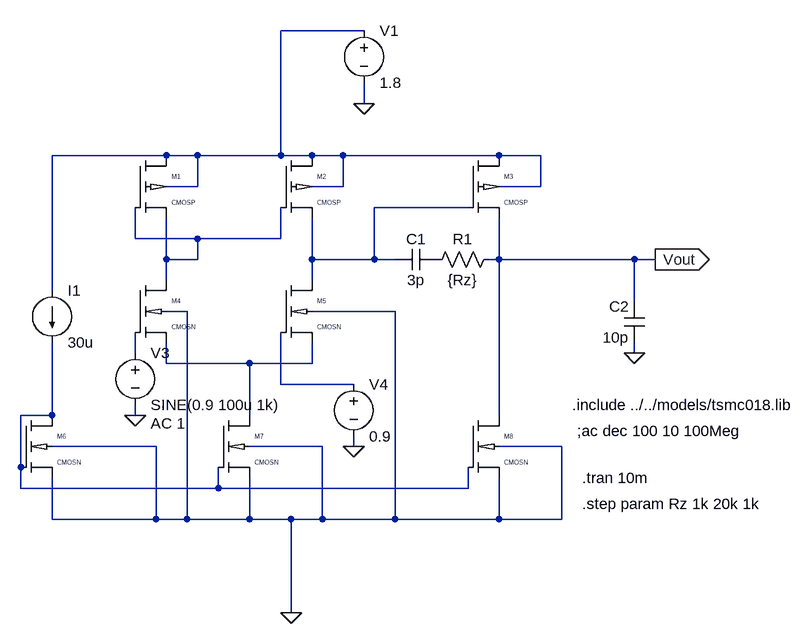
[diagram p0: schematic 2-Stage op-Amp.asc]
2-Stage op-Amp.asc, the LTspice schematic file:
Version 4.1
SHEET 1 1564 852
WIRE 432 -144 304 -144
WIRE 432 -32 432 -64
WIRE 128 48 -48 48
WIRE 176 48 128 48
WIRE 304 48 304 -144
WIRE 304 48 176 48
WIRE 352 48 304 48
WIRE 400 48 352 48
WIRE 640 48 400 48
WIRE 704 48 640 48
WIRE 176 96 176 48
WIRE 176 96 128 96
WIRE 400 96 400 48
WIRE 400 96 352 96
WIRE 704 96 704 48
WIRE 704 96 640 96
WIRE 592 128 448 128
WIRE 80 176 80 128
WIRE 176 176 80 176
WIRE 304 176 304 128
WIRE 304 176 176 176
WIRE 128 208 128 144
WIRE 176 208 176 176
WIRE 176 208 128 208
WIRE 352 208 352 144
WIRE 448 208 448 128
WIRE 448 208 352 208
WIRE 480 208 448 208
WIRE 640 208 640 144
WIRE 640 208 624 208
WIRE 848 208 640 208
WIRE 880 208 848 208
WIRE 128 240 128 208
WIRE 352 240 352 208
WIRE -48 256 -48 48
WIRE 848 272 848 208
WIRE 160 288 128 288
WIRE 480 288 352 288
WIRE 80 352 80 320
WIRE 848 352 848 336
WIRE 128 368 128 336
WIRE 256 368 128 368
WIRE 352 368 352 336
WIRE 352 368 256 368
WIRE 304 400 304 320
WIRE 416 400 304 400
WIRE -48 448 -48 336
WIRE -48 448 -96 448
WIRE 80 448 80 432
WIRE 256 448 256 368
WIRE 640 448 640 208
WIRE 112 496 -48 496
WIRE 368 496 256 496
WIRE 416 496 416 480
WIRE 736 496 640 496
WIRE -96 528 -96 448
WIRE -96 560 -96 528
WIRE 208 560 208 528
WIRE 208 560 -96 560
WIRE 592 560 592 528
WIRE 592 560 208 560
WIRE -48 608 -48 544
WIRE 112 608 112 496
WIRE 112 608 -48 608
WIRE 160 608 160 288
WIRE 160 608 112 608
WIRE 256 608 256 544
WIRE 256 608 160 608
WIRE 320 608 256 608
WIRE 368 608 368 496
WIRE 368 608 320 608
WIRE 480 608 480 288
WIRE 480 608 368 608
WIRE 640 608 640 544
WIRE 640 608 480 608
WIRE 736 608 736 496
WIRE 736 608 640 608
WIRE 320 752 320 608
FLAG 848 352 0
FLAG 880 208 Vout
IOPIN 880 208 Out
FLAG 432 -32 0
FLAG 80 448 0
FLAG 416 496 0
FLAG 320 752 0
SYMBOL sym\\cmosp 80 48 R0
SYMATTR InstName M1
SYMATTR Value2 l=0.5u w=20u
SYMBOL sym\\cmosp 304 48 R0
SYMATTR InstName M2
SYMATTR Value2 l=0.5u w=20u
SYMBOL sym\\cmosp 592 48 R0
SYMATTR InstName M3
SYMATTR Value2 l=0.5u w=40u
SYMBOL sym\\cmosn 80 240 R0
SYMATTR InstName M4
SYMATTR Value2 l=0.5u w=10u
SYMBOL sym\\cmosn 304 240 R0
SYMATTR InstName M5
SYMATTR Value2 l=0.5u w=10u
SYMBOL sym\\cmosn -96 448 R0
SYMATTR InstName M6
SYMATTR Value2 l=0.5u w=5u
SYMBOL sym\\cmosn 208 448 R0
SYMATTR InstName M7
SYMATTR Value2 l=0.5u w=5u
SYMBOL sym\\cmosn 592 448 R0
SYMATTR InstName M8
SYMATTR Value2 l=0.5u w=5u
SYMBOL current -48 256 R0
SYMATTR InstName I1
SYMATTR Value 30u
SYMBOL cap 544 192 R90
WINDOW 0 0 32 VBottom 2
WINDOW 3 32 32 VTop 2
SYMATTR InstName C1
SYMATTR Value 3p
SYMBOL cap 864 336 R180
WINDOW 0 24 56 Left 2
WINDOW 3 24 8 Left 2
SYMATTR InstName C2
SYMATTR Value 10p
SYMBOL voltage 80 336 R0
WINDOW 123 24 124 Left 2
WINDOW 39 0 0 Left 0
SYMATTR InstName V3
SYMATTR Value SINE(0.9 100u 1k)
SYMATTR Value2 AC 1
SYMBOL voltage 416 384 R0
WINDOW 123 0 0 Left 0
WINDOW 39 0 0 Left 0
SYMATTR InstName V4
SYMATTR Value 0.9
SYMBOL voltage 432 -160 R0
WINDOW 123 0 0 Left 0
WINDOW 39 0 0 Left 0
SYMATTR InstName V1
SYMATTR Value 1.8
SYMBOL res 640 192 R90
WINDOW 0 0 56 VBottom 2
WINDOW 3 32 56 VTop 2
SYMATTR InstName R1
SYMATTR Value {Rz}
TEXT 752 432 Left 2 !.include ../../models/tsmc018.lib
TEXT 760 472 Left 2 !;ac dec 100 10 100Meg
TEXT 768 584 Left 2 !.step param Rz 1k 20k 1k
TEXT 768 544 Left 2 !.tran 10m

The netlist it stands for:
* 2-Stage op-Amp.asc
M1 N001 N003 N003 N001 CMOSP l=0.5u w=20u
M2 N001 N003 N002 N001 CMOSP l=0.5u w=20u
M3 N001 N002 Vout N001 CMOSP l=0.5u w=40u
M4 N003 N004 N005 0 CMOSN l=0.5u w=10u
M5 N002 N006 N005 0 CMOSN l=0.5u w=10u
M6 N007 N007 0 0 CMOSN l=0.5u w=5u
M7 N005 N007 0 0 CMOSN l=0.5u w=5u
M8 Vout N007 0 0 CMOSN l=0.5u w=5u
I1 N001 N007 30u
C1 P001 N002 3p
C2 0 Vout 10p
V3 N004 0 SINE(0.9 100u 1k) AC 1
V4 N006 0 0.9
V1 N001 0 1.8
R1 Vout P001 {Rz}
.model NMOS NMOS
.model PMOS PMOS
.lib standard.mos
.include ../../models/tsmc018.lib
;ac dec 100 10 100Meg
.step param Rz 1k 20k 1k
.tran 10m
.lib tsmc018.lib
.backanno
.end